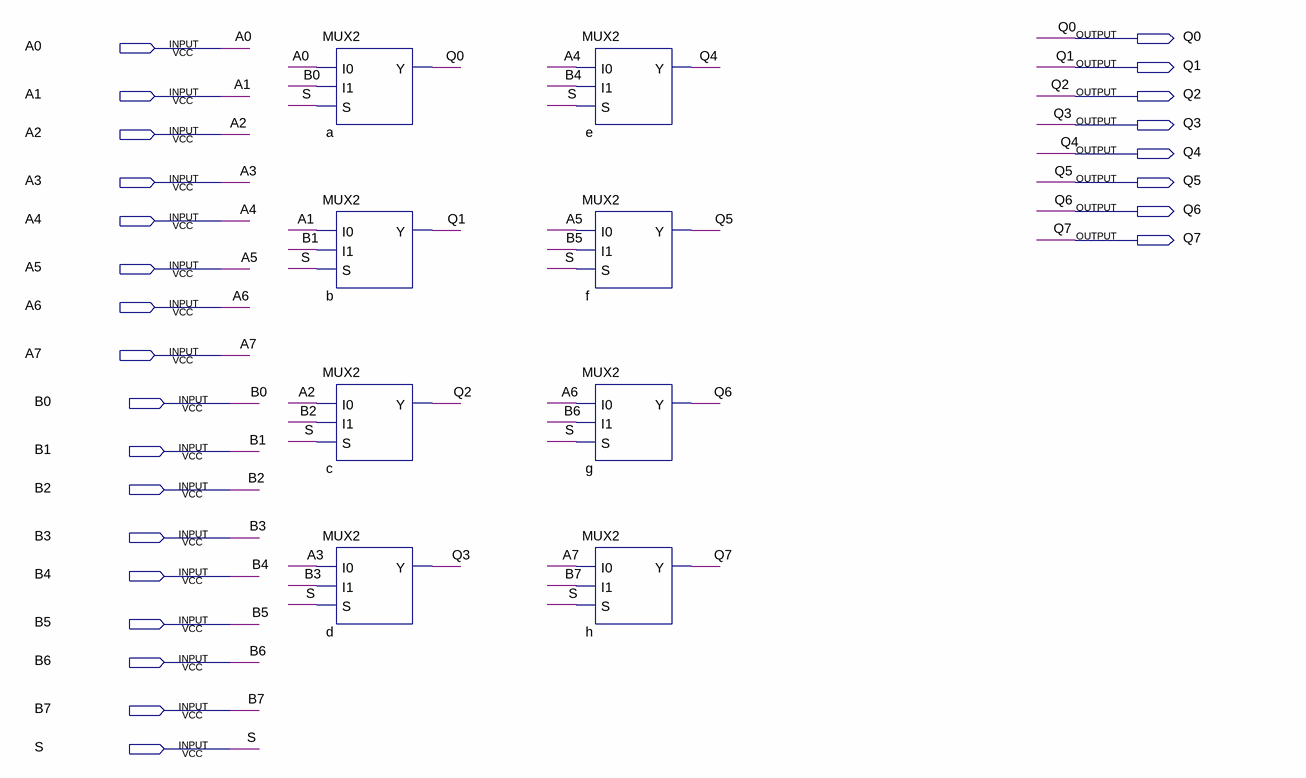
[diagram p0: schematic sheet]
// Quartus schematic MUX2_8b.bdf as structural Verilog: 8 symbols, 25 pins
module MUX2_8b (
  input  A0,
  input  A1,
  input  A2,
  input  A3,
  input  A4,
  input  A5,
  input  A6,
  input  A7,
  input  B0,
  input  B1,
  input  B2,
  input  B3,
  input  B4,
  input  B5,
  input  B6,
  input  B7,
  input  S,
  output Q0,
  output Q1,
  output Q2,
  output Q3,
  output Q4,
  output Q5,
  output Q6,
  output Q7
);

  MUX2 a (.I0(A0), .I1(B0), .S(S), .Y(Q0));
  MUX2 b (.I0(A1), .I1(B1), .S(S), .Y(Q1));
  MUX2 c (.I0(A2), .I1(B2), .S(S), .Y(Q2));
  MUX2 d (.I0(A3), .I1(B3), .S(S), .Y(Q3));
  MUX2 e (.I0(A4), .I1(B4), .S(S), .Y(Q4));
  MUX2 f (.I0(A5), .I1(B5), .S(S), .Y(Q5));
  MUX2 g (.I0(A6), .I1(B6), .S(S), .Y(Q6));
  MUX2 h (.I0(A7), .I1(B7), .S(S), .Y(Q7));
endmodule
